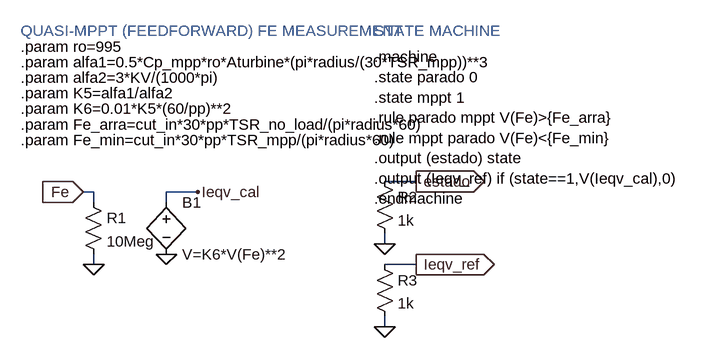
[diagram p0: schematic MCU_cuasi_mppt_Fe.asc]
MCU_cuasi_mppt_Fe.asc, the LTspice schematic file:
Version 4.1
SHEET 1 948 720
WIRE 320 -32 272 -32
WIRE -176 -16 -192 -16
WIRE -16 -16 -64 -16
WIRE -176 0 -176 -16
WIRE -64 0 -64 -16
WIRE 272 64 272 48
WIRE -176 96 -176 80
WIRE 320 96 272 96
WIRE 272 192 272 176
FLAG -192 -16 Fe
IOPIN -192 -16 In
FLAG -176 96 0
FLAG 320 -32 estado
IOPIN 320 -32 Out
FLAG 272 64 0
FLAG 320 96 Ieqv_ref
IOPIN 320 96 Out
FLAG 272 192 0
FLAG -64 80 0
FLAG -16 -16 Ieqv_cal
SYMBOL res -192 -16 R0
SYMATTR InstName R1
SYMATTR Value 10Meg
SYMBOL res 256 -48 R0
SYMATTR InstName R2
SYMATTR Value 1k
SYMBOL res 256 80 R0
SYMATTR InstName R3
SYMATTR Value 1k
SYMBOL bv -64 -16 R0
SYMATTR InstName B1
SYMATTR Value V=K6*V(Fe)**2
TEXT 256 -224 Left 2 !.machine\n.state parado 0\n.state mppt 1\n.rule parado mppt V(Fe)>{Fe_arra}\n.rule mppt parado V(Fe)<{Fe_min}\n.output (estado) state\n.output (Ieqv_ref) if (state==1,V(Ieqv_cal),0)\n.endmachine
TEXT -288 -240 Left 2 !.param ro=995
TEXT -288 -216 Left 2 !.param alfa1=0.5*Cp_mpp*ro*Aturbine*(pi*radius/(30*TSR_mpp))**3
TEXT -288 -192 Left 2 !.param alfa2=3*KV/(1000*pi)
TEXT -288 -168 Left 2 !.param K5=alfa1/alfa2
TEXT -288 -120 Left 2 !.param Fe_arra=cut_in*30*pp*TSR_no_load/(pi*radius*60)
TEXT -288 -96 Left 2 !.param Fe_min=cut_in*30*pp*TSR_mpp/(pi*radius*60)
TEXT -288 -144 Left 2 !.param K6=0.01*K5*(60/pp)**2
TEXT 256 -264 Left 2 ;STATE MACHINE
TEXT -288 -264 Left 2 ;QUASI-MPPT (FEEDFORWARD) FE MEASUREMENT

The netlist it stands for:
* MCU_cuasi_mppt_Fe.asc
R1 Fe 0 10Meg
R2 estado 0 1k
R3 Ieqv_ref 0 1k
B1 Ieqv_cal 0 V=K6*V(Fe)**2
.machine
.state parado 0
.state mppt 1
.rule parado mppt V(Fe)>{Fe_arra}
.rule mppt parado V(Fe)<{Fe_min}
.output (estado) state
.output (Ieqv_ref) if (state==1,V(Ieqv_cal),0)
.endmachine
.param ro=995
.param alfa1=0.5*Cp_mpp*ro*Aturbine*(pi*radius/(30*TSR_mpp))**3
.param alfa2=3*KV/(1000*pi)
.param K5=alfa1/alfa2
.param Fe_arra=cut_in*30*pp*TSR_no_load/(pi*radius*60)
.param Fe_min=cut_in*30*pp*TSR_mpp/(pi*radius*60)
.param K6=0.01*K5*(60/pp)**2
* STATE MACHINE
* QUASI-MPPT (FEEDFORWARD) FE MEASUREMENT
.backanno
.end